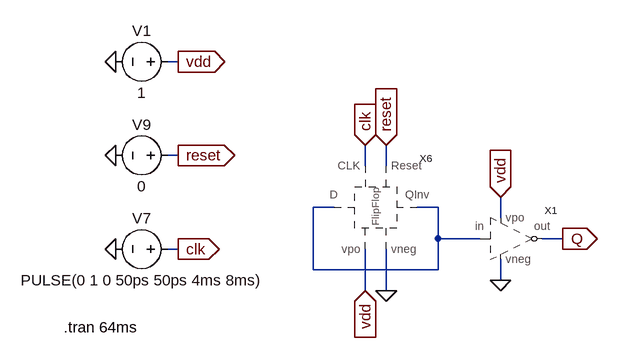
[diagram p0: schematic test.asc]
test.asc, the LTspice schematic file:
Version 4
SHEET 1 1788 2200
WIRE 64 1760 48 1760
WIRE 64 1904 48 1904
WIRE 352 1920 352 1888
WIRE 384 1920 384 1888
WIRE 304 1984 272 1984
WIRE 464 1984 432 1984
WIRE 560 2000 560 1968
WIRE 464 2032 464 1984
WIRE 528 2032 464 2032
WIRE 656 2032 624 2032
WIRE 64 2048 48 2048
WIRE 272 2080 272 1984
WIRE 464 2080 464 2032
WIRE 464 2080 272 2080
WIRE 560 2096 560 2064
WIRE 352 2112 352 2048
WIRE 384 2112 384 2048
FLAG 384 2112 0
FLAG 352 2112 vdd
IOPIN 352 2112 In
FLAG -32 2048 0
FLAG 64 2048 clk
IOPIN 64 2048 Out
FLAG -32 1904 0
FLAG 64 1904 reset
IOPIN 64 1904 Out
FLAG -32 1760 0
FLAG 64 1760 vdd
IOPIN 64 1760 Out
FLAG 352 1888 clk
IOPIN 352 1888 In
FLAG 384 1888 reset
IOPIN 384 1888 In
FLAG 560 1968 vdd
IOPIN 560 1968 In
FLAG 560 2096 0
FLAG 656 2032 Q
IOPIN 656 2032 Out
SYMBOL DFlipFlop 368 1984 R0
SYMATTR InstName X6
SYMBOL Voltage 64 2048 R90
WINDOW 0 -32 56 VBottom 2
WINDOW 3 32 56 VTop 2
SYMATTR InstName V7
SYMATTR Value PULSE(0 1 0 50ps 50ps 4ms 8ms)
SYMBOL Voltage 64 1904 R90
WINDOW 0 -32 56 VBottom 2
WINDOW 3 32 56 VTop 2
SYMATTR InstName V9
SYMATTR Value 0
SYMBOL Voltage 64 1760 R90
WINDOW 0 -32 56 VBottom 2
WINDOW 3 32 56 VTop 2
SYMATTR InstName V1
SYMATTR Value 1
SYMBOL Inverter 560 2032 R0
SYMATTR InstName X1
TEXT -112 2168 Left 2 !.tran 64ms

The netlist it stands for:
* test.asc
XX6 clk N001 reset N001 vdd 0 DFlipFlop  ; pins CLK D Reset QInv vpo vneg
V7 clk 0 PULSE(0 1 0 50ps 50ps 4ms 8ms)
V9 reset 0 0
V1 vdd 0 1
XX1 N001 Q vdd 0 Inverter  ; pins in out vpo vneg
.tran 64ms
.backanno
.end